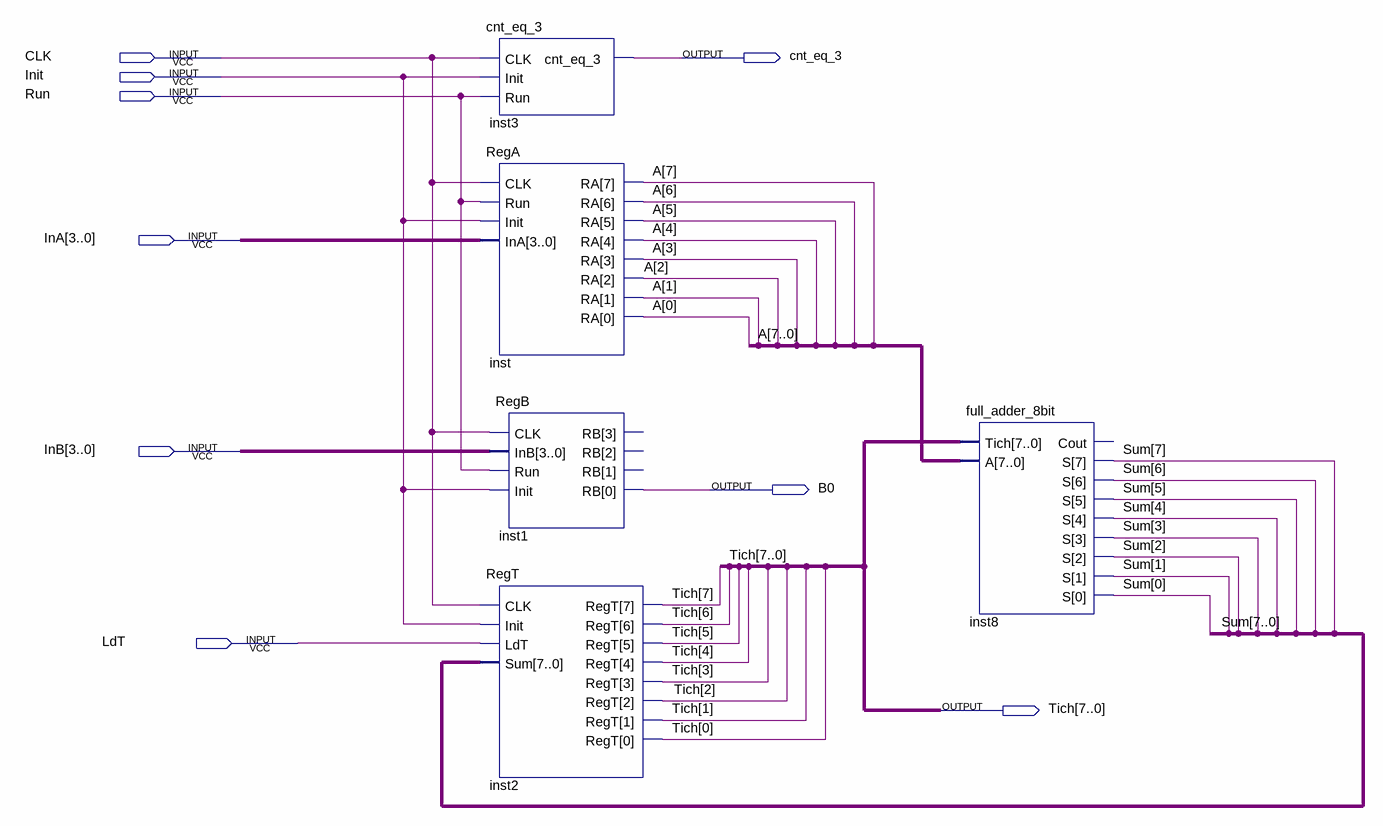
[diagram p0: schematic sheet]
// Quartus schematic datapath.bdf as structural Verilog: 5 symbols, 9 pins
module datapath (
  input  CLK,
  input  Init,
  input  Run,
  input  [3:0] InA,
  input  [3:0] InB,
  input  LdT,
  output cnt_eq_3,
  output B0,
  output [7:0] Tich
);

  wire [7:0] A, Sum;
  wire [3:0] inst1_rb_open;  // unused outputs

  cnt_eq_3 inst3 (.CLK(CLK), .Init(Init), .Run(Run), .cnt_eq_3(cnt_eq_3));
  RegA inst (.CLK(CLK), .Run(Run), .Init(Init), .InA(InA), .RA(A));
  RegB inst1 (.CLK(CLK), .InB(InB), .Run(Run), .Init(Init), .RB({inst1_rb_open[3:1], B0}));
  RegT inst2 (.CLK(CLK), .Init(Init), .LdT(LdT), .Sum(Sum), .RegT(Tich));
  full_adder_8bit inst8 (.Tich(Tich), .A(A), .S(Sum));  // open: Cout
endmodule
